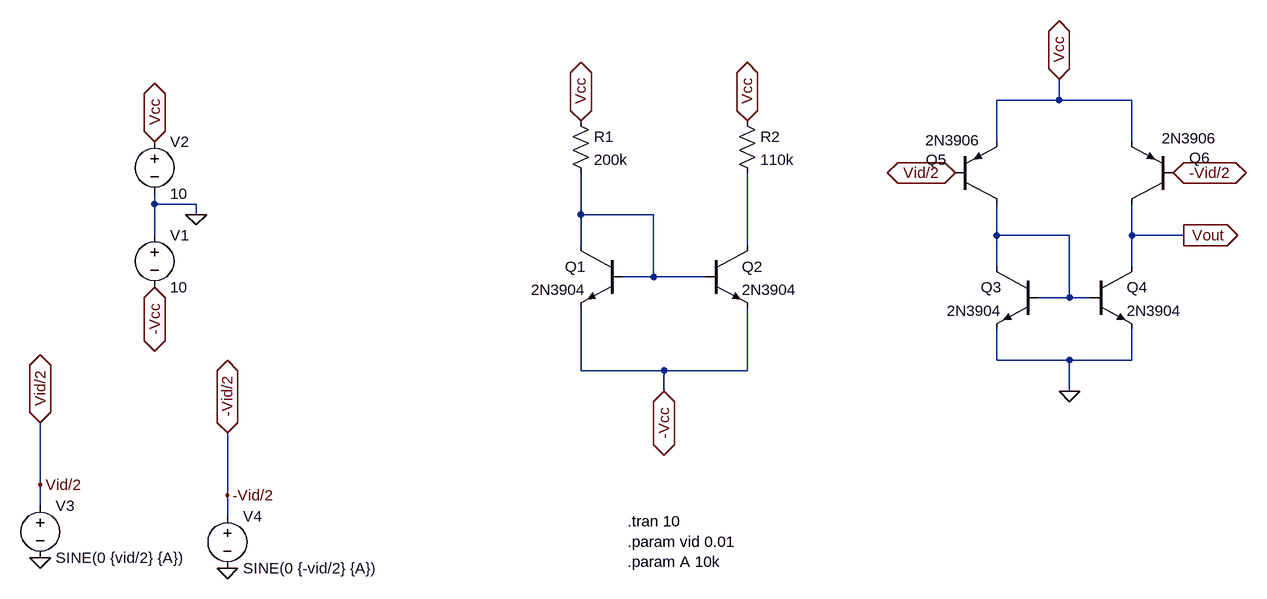
[diagram p0: schematic current_mirror_and_diff_amp.asc]
current_mirror_and_diff_amp.asc, the LTspice schematic file:
Version 4
SHEET 1 1732 816
WIRE 1200 -16 1200 -48
WIRE 1200 -16 1104 -16
WIRE 1312 -16 1200 -16
WIRE 1104 48 1104 -16
WIRE 1312 48 1312 -16
WIRE -192 144 -192 128
WIRE -128 144 -192 144
WIRE -128 160 -128 144
WIRE 464 160 464 96
WIRE 576 160 464 160
WIRE -192 192 -192 144
WIRE 1104 192 1104 144
WIRE 1216 192 1104 192
WIRE 1312 192 1312 144
WIRE 1392 192 1312 192
WIRE 464 208 464 160
WIRE 720 208 720 96
WIRE 1104 240 1104 192
WIRE 1312 240 1312 192
WIRE 576 256 576 160
WIRE 576 256 528 256
WIRE 656 256 576 256
WIRE 1216 288 1216 192
WIRE 1216 288 1168 288
WIRE 1248 288 1216 288
WIRE 1104 384 1104 336
WIRE 1216 384 1104 384
WIRE 1312 384 1312 336
WIRE 1312 384 1216 384
WIRE 464 400 464 304
WIRE 592 400 464 400
WIRE 720 400 720 304
WIRE 720 400 592 400
WIRE 592 432 592 400
WIRE 1216 432 1216 384
WIRE -368 576 -368 480
WIRE -80 592 -80 496
WIRE -368 608 -368 576
WIRE -80 624 -80 592
FLAG -128 160 0
FLAG -192 272 -Vcc
IOPIN -192 272 BiDir
FLAG -192 48 Vcc
IOPIN -192 48 BiDir
FLAG -368 688 0
FLAG -368 576 Vid/2
FLAG 464 16 Vcc
IOPIN 464 16 BiDir
FLAG 720 16 Vcc
IOPIN 720 16 BiDir
FLAG 1392 192 Vout
IOPIN 1392 192 Out
FLAG 1216 432 0
FLAG 592 432 -Vcc
IOPIN 592 432 BiDir
FLAG 1200 -48 Vcc
IOPIN 1200 -48 BiDir
FLAG -80 704 0
FLAG -80 592 -Vid/2
FLAG -368 480 Vid/2
IOPIN -368 480 BiDir
FLAG -80 496 -Vid/2
IOPIN -80 496 BiDir
FLAG 1040 96 Vid/2
IOPIN 1040 96 BiDir
FLAG 1376 96 -Vid/2
IOPIN 1376 96 BiDir
SYMBOL Voltage -192 176 R0
SYMATTR InstName V1
SYMATTR Value 10
SYMBOL Voltage -192 32 R0
SYMATTR InstName V2
SYMATTR Value 10
SYMBOL Voltage -368 592 R0
SYMATTR InstName V3
SYMATTR Value SINE(0 {vid/2} {A})
SYMATTR Value2 AC {vid/2}
SYMBOL npn 528 208 M0
SYMATTR InstName Q1
SYMATTR Value 2N3904
SYMBOL npn 656 208 R0
SYMATTR InstName Q2
SYMATTR Value 2N3904
SYMBOL Res 448 0 R0
SYMATTR InstName R1
SYMATTR Value 200k
SYMBOL Res 704 0 R0
SYMATTR InstName R2
SYMATTR Value 110k
SYMBOL npn 1168 240 M0
SYMATTR InstName Q3
SYMATTR Value 2N3904
SYMBOL npn 1248 240 R0
SYMATTR InstName Q4
SYMATTR Value 2N3904
SYMBOL pnp 1040 144 M180
WINDOW 0 -45 68 Left 2
WINDOW 3 -46 98 Left 2
SYMATTR InstName Q5
SYMATTR Value 2N3906
SYMBOL pnp 1376 144 R180
WINDOW 0 -57 71 Left 2
WINDOW 3 -67 101 Left 2
SYMATTR InstName Q6
SYMATTR Value 2N3906
SYMBOL Voltage -80 608 R0
SYMATTR InstName V4
SYMATTR Value SINE(0 {-vid/2} {A})
SYMATTR Value2 AC {-vid/2}
TEXT 536 632 Left 2 !.tran 10\n.param vid 0.01\n.param A 10k

The netlist it stands for:
* current_mirror_and_diff_amp.asc
V1 0 -Vcc 10
V2 Vcc 0 10
V3 Vid/2 0 SINE(0 {vid/2} {A}) AC {vid/2}
Q1 N001 N001 -Vcc 0 2N3904
Q2 N003 N001 -Vcc 0 2N3904
R1 Vcc N001 200k
R2 Vcc N003 110k
Q3 N002 N002 0 0 2N3904
Q4 Vout N002 0 0 2N3904
Q5 N002 Vid/2 Vcc 0 2N3906
Q6 Vout -Vid/2 Vcc 0 2N3906
V4 -Vid/2 0 SINE(0 {-vid/2} {A}) AC {-vid/2}
.model NPN NPN
.model PNP PNP
.lib standard.bjt
.tran 10
.param vid 0.01
.param A 10k
.backanno
.end